# Altium project BB-18 Control Board.PrjPcb (part 2 of 2)

## Sheet Power Supplies.SchDoc
size A; SheetNumber: 3; SheetTotal: 5
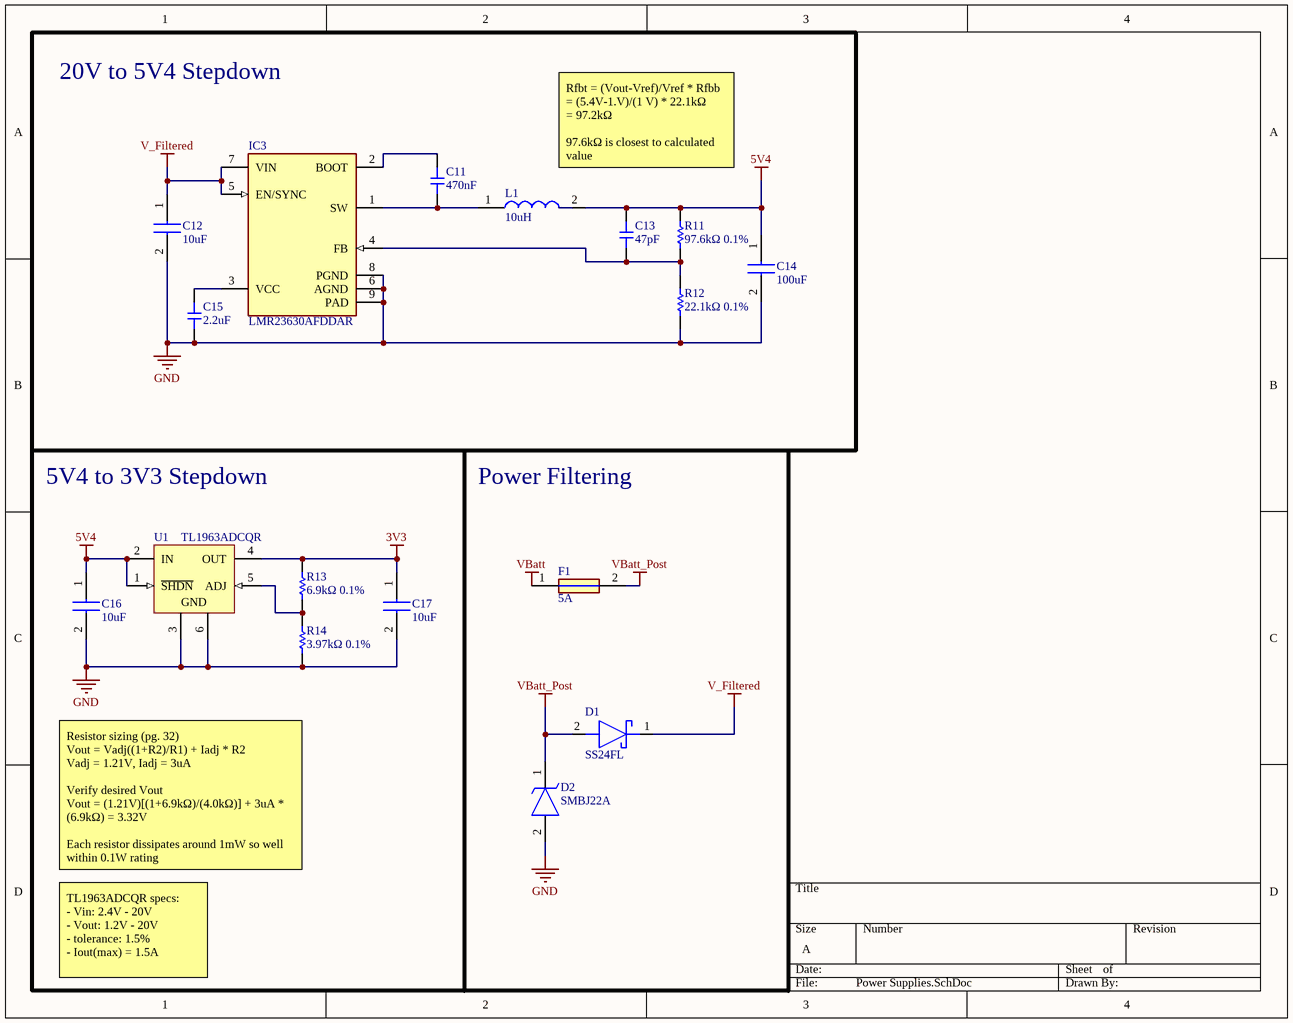
[diagram p4: Power Supplies.SchDoc]

### Parts
C11  Capacitance: 470nF  [CAP-0603]  (hidden comment: CL10B474KA8NNNC)
C12  10uF  [CAPC3225X270N]
C13  Capacitance: 47pF  [CAP-0603]  (hidden comment: CL10C470JB8NNNC)
C14  100uF  [CAPC3225X279N]
C15  Capacitance: 2.2uF  [CAP-0603]  (hidden comment: CL10A225KO8NNNC)
C16  10uF  [CAPC1608X90N]
C17  10uF  [CAPC1608X90N]
D1  SS24FL  [SODFL3617X108N]
D2  SMBJ22A  [SMBJ12A]
F1  5A  [FUSC1608X95N]
IC3  LMR23630AFDDAR  [SOIC127P600X170-9N]
L1  10uH  [SRP6540]
R11  97.6kΩ 0.1%  [RESC1608X55N]
R12  22.1kΩ 0.1%  [RESC1608X55N]
R13  6.9kΩ 0.1%  [RESC1608X55N]
R14  3.97kΩ 0.1%  [RESC1608X55N]
U1  TL1963ADCQR  [DCQ0006A_M]

### Nets
3V3: C17.1 R13.2 U1.4(OUT)
5V4: C13.2 C14.1 C16.1 L1.2 R11.2 U1.1(~{SHDN}) U1.2(IN)
GND: C12.2 C14.2 C15.1 C16.2 C17.2 D2.2(A) IC3.6(AGND) IC3.8(PGND) IC3.9(PAD) R12.1 R14.1 U1.3(GND) U1.6(GND)
V_Filtered: C12.1 D1.1(K) IC3.5(EN/SYNC) IC3.7(VIN)
Vbatt: F1.1
VBatt_Post: D1.2(A) D2.1(K) F1.2
NetC11_1: C11.1 IC3.1(SW) L1.1
NetC11_2: C11.2 IC3.2(BOOT)
NetC13_1: C13.1 IC3.4(FB) R11.1 R12.2
NetC15_2: C15.2 IC3.3(VCC)
NetR13_1: R13.1 R14.2 U1.5(ADJ)

### Notes on the sheet
- 20V to 5V4 Stepdown
- Rfbt = (Vout-Vref)/Vref * Rfbb
  = (5.4V-1.V)/(1 V) * 22.1kΩ
  = 97.2kΩ
  97.6kΩ is closest to calculated value
- 5V4 to 3V3 Stepdown
- Power Filtering
- Resistor sizing (pg. 32)
  Vout = Vadj((1+R2)/R1) + Iadj * R2
  Vadj = 1.21V, Iadj = 3uA
  Verify desired Vout
  Vout = (1.21V)[(1+6.9kΩ)/(4.0kΩ)] + 3uA * (6.9kΩ) = 3.32V
  Each resistor dissipates around 1mW so well within 0.1W rating
- TL1963ADCQR specs:
  - Vin: 2.4V - 20V
  - Vout: 1.2V - 20V
  - tolerance: 1.5%
  - Iout(max) = 1.5A

### Library data of the parts
C11 = CL10B474KA8NNNC: Capacitor, Ceramic (MLCC), 470nF, ±10%, 25V, X7R, ±10%, SMD 0603; Manufacturer: Samsung Electro-Mechanics; Temperature Rating: -55°C ~ 125°C; Capacitance @ 1V DC Bias: 478.182nF; Capacitance @ 1.2V DC Bias: 478.296nF; Capacitance @ 1.35V DC Bias: 478.281nF; Capacitance @ 1.5V DC Bias: 478.153nF; Capacitance @ 1.8V DC Bias: 477.489nF; Capacitance @ 2.5V DC Bias: 472.414nF; Capacitance @ 3.3V DC Bias: 462.957nF; Capacitance @ 3.7V DC Bias: 457.410nF; Capacitance @ 4.2V DC Bias: 450.090nF; Capacitance @ 5V DC Bias: 437.532nF; Capacitance @ 9V DC Bias: 369.261nF; Capacitance @ 12V DC Bias: 317.341nF; Capacitance @ 15V DC Bias: 268.462nF; Capacitance @ 24V DC Bias: 160.798nF; Impedance (0V Bias) @ 100Hz: 3.92E+03Ω; Impedance (0V Bias) @ 500Hz: 796Ω; Impedance (0V Bias) @ 1kHz: 401Ω; Impedance (0V Bias) @ 5kHz: 81.2Ω; Impedance (0V Bias) @ 10kHz: 40.9Ω; Impedance (0V Bias) @ 50kHz: 8.29Ω; Impedance (0V Bias) @ 100kHz: 4.17Ω; Impedance (0V Bias) @ 500kHz: 0.844Ω; Impedance (0V Bias) @ 1MHz: 0.422Ω; Impedance (0V Bias) @ 5MHz: 0.0719Ω; Impedance (0V Bias) @ 10MHz: 0.0175Ω; Impedance (0V Bias) @ 50MHz: 0.0949Ω; Impedance (0V Bias) @ 100MHz: 0.17Ω; Impedance (0V Bias) @ 500MHz: 0.717Ω; Impedance (0V Bias) @ 1GHz: 1.36Ω; Impedance (0V Bias) @ 2GHz: 3.45Ω; Impedance (0V Bias) @ 5GHz: 7.51Ω; Impedance (25V Bias) @ 100Hz: 1.18E+04Ω; Impedance (25V Bias) @ 500Hz: 2.38E+03Ω; Impedance (25V Bias) @ 1kHz: 1.2E+03Ω; Impedance (25V Bias) @ 5kHz: 242Ω; Impedance (25V Bias) @ 10kHz: 121Ω; Impedance (25V Bias) @ 50kHz: 24.5Ω; Impedance (25V Bias) @ 100kHz: 12.3Ω; Impedance (25V Bias) @ 500kHz: 2.47Ω; Impedance (25V Bias) @ 1MHz: 1.22Ω; Impedance (25V Bias) @ 5MHz: 0.256Ω; Impedance (25V Bias) @ 10MHz: 0.109Ω; Impedance (25V Bias) @ 50MHz: 0.11Ω; Impedance (25V Bias) @ 100MHz: 0.171Ω; Impedance (25V Bias) @ 500MHz: 0.718Ω; Impedance (25V Bias) @ 2GHz: 3.41Ω; Impedance (25V Bias) @ 5GHz: 7.6Ω; Package Size: 0603; JLCPCB Basic Part: Yes; JLCPCB Part Number: C1623; Supplier 1: LCSC; Category: Capacitors - MLCC; Supplier Part Number 1: C1623; Manufacturer Part Number: CL10B474KA8NNNC; Tolerance: ±10%; Voltage Rating: 25V; Temperature Coefficient: X7R; RoHS: Yes; ComponentLink1Description: Datasheet; ComponentLink1URL: https://wmsc.lcsc.com/wmsc/upload/file/pdf/v2/lcsc/2304140030_Samsung-Electro-Mechanics-CL10B474KA8NNNC_C1623.pdf; ComponentLink2Description: JLCPCB Part URL; ComponentLink2URL: https://jlcpcb.com/partdetail/C1623; ComponentLink3Description: LCSC Part URL; ComponentLink3URL: https://lcsc.com/product-detail/Multilayer-Ceramic-Capacitors-MLCC---SMD-SMT_Samsung-Electro-Mechanics-Samsung-Electro-Mechanics-CL10B474KA8NNNC_C1623.html; ComponentLink4Description: Samsung Component Library; ComponentLink4URL: https://weblib.samsungsem.com/mlcc/mlcc-ec.do?partNumber=CL10B474KA8NNN; Impedance (25V Bias) @ 1GHz: 1.36Ω
C12 = CL32B106KBJNNNE: CAP CER 10UF 50V X7R 1210; Manufacturer_Name: SAMSUNG; Datasheet Link: https://datasheet.datasheetarchive.com/originals/distributors/Datasheets-DGA10/2406903.pdf; Height: 2.7mm; Manufacturer_Part_Number: CL32B106KBJNNNE; Mouser Part Number: 187-CL32B106KBJNNNE; Mouser Price/Stock: https://www.mouser.co.uk/ProductDetail/Samsung-Electro-Mechanics/CL32B106KBJNNNE?qs=349EhDEZ59rXK%2FOM74I5cg%3D%3D; Arrow Part Number: CL32B106KBJNNNE; Arrow Price/Stock: https://www.arrow.com/en/products/cl32b106kbjnnne/samsung-electro-mechanics.html?utm_currency=USD&region=nac
C13 = CL10C470JB8NNNC: Capacitor, Ceramic (MLCC), 47pF, ±5%, 50V, C0G, ±5%, SMD 0603; Manufacturer: Samsung Electro-Mechanics; Temperature Rating: -55°C ~ 125°C; Impedance (0V Bias) @ 100MHz: 33.5Ω; Impedance (0V Bias) @ 500MHz: 4.98Ω; Impedance (0V Bias) @ 1GHz: 0.296Ω; Impedance (0V Bias) @ 2GHz: 7.28Ω; Impedance (0V Bias) @ 5GHz: 16.2Ω; Package Size: 0603; JLCPCB Basic Part: Yes; JLCPCB Part Number: C1671; Supplier 1: LCSC; Category: Capacitors - MLCC; Supplier Part Number 1: C1671; Manufacturer Part Number: CL10C470JB8NNNC; Tolerance: ±5%; Voltage Rating: 50V; Temperature Coefficient: C0G; RoHS: Yes; ComponentLink1Description: Datasheet; ComponentLink1URL: https://wmsc.lcsc.com/wmsc/upload/file/pdf/v2/lcsc/2304140030_Samsung-Electro-Mechanics-CL10C470JB8NNNC_C1671.pdf; ComponentLink2Description: JLCPCB Part URL; ComponentLink2URL: https://jlcpcb.com/partdetail/C1671; ComponentLink3Description: LCSC Part URL; ComponentLink3URL: https://lcsc.com/product-detail/Multilayer-Ceramic-Capacitors-MLCC---SMD-SMT_Samsung-Electro-Mechanics-Samsung-Electro-Mechanics-CL10C470JB8NNNC_C1671.html; ComponentLink4Description: Samsung Component Library; ComponentLink4URL: https://weblib.samsungsem.com/mlcc/mlcc-ec.do?partNumber=CL10C470JB8NNN
C14 = 1210YD107MAT2A: CAP CER 100UF 16V X5R 1210; Manufacturer_Name: Kyocera AVX; Datasheet Link: https://datasheet.datasheetarchive.com/originals/distributors/DKDS40/DSANUWW008853.pdf; Height: 2.79mm; Manufacturer_Part_Number: 1210YD107MAT2A; Mouser Part Number: 581-1210YD107MAT2A; Mouser Price/Stock: https://www.mouser.co.uk/ProductDetail/KYOCERA-AVX/1210YD107MAT2A?qs=dTuOkNN7mNJArH0RUYK6ig%3D%3D; Arrow Part Number: 1210YD107MAT2A; Arrow Price/Stock: https://www.arrow.com/en/products/1210yd107mat2a/avx.html?utm_currency=USD&region=asia
C15 = CL10A225KO8NNNC: Capacitor, Ceramic (MLCC), 2.2uF, ±10%, 16V, X5R, ±10%, SMD 0603; Manufacturer: Samsung Electro-Mechanics; Temperature Rating: -55°C ~ 85°C; Capacitance @ 1V DC Bias: 2.290uF; Capacitance @ 1.2V DC Bias: 2.232uF; Capacitance @ 1.35V DC Bias: 2.184uF; Capacitance @ 1.5V DC Bias: 2.135uF; Capacitance @ 1.8V DC Bias: 2.033uF; Capacitance @ 2.5V DC Bias: 1.780uF; Capacitance @ 3.3V DC Bias: 1.490uF; Capacitance @ 3.7V DC Bias: 1.365uF; Capacitance @ 4.2V DC Bias: 1.230uF; Capacitance @ 5V DC Bias: 1.046uF; Capacitance @ 9V DC Bias: 0.530uF; Capacitance @ 12V DC Bias: 0.397uF; Capacitance @ 15V DC Bias: 0.295uF; Impedance (0V Bias) @ 100Hz: 748Ω; Impedance (0V Bias) @ 500Hz: 156Ω; Impedance (0V Bias) @ 1kHz: 79.1Ω; Impedance (0V Bias) @ 5kHz: 16.4Ω; Impedance (0V Bias) @ 10kHz: 8.3Ω; Impedance (0V Bias) @ 50kHz: 1.7Ω; Impedance (0V Bias) @ 100kHz: 0.86Ω; Impedance (0V Bias) @ 500kHz: 0.176Ω; Impedance (0V Bias) @ 1MHz: 0.0866Ω; Impedance (0V Bias) @ 5MHz: 0.00777Ω; Impedance (0V Bias) @ 10MHz: 0.0257Ω; Impedance (0V Bias) @ 50MHz: 0.0946Ω; Impedance (0V Bias) @ 100MHz: 0.166Ω; Impedance (0V Bias) @ 500MHz: 0.651Ω; Impedance (0V Bias) @ 1GHz: 1.17Ω; Impedance (0V Bias) @ 2GHz: 2.75Ω; Impedance (0V Bias) @ 5GHz: 5.64Ω; Impedance (16V Bias) @ 100Hz: 5.28E+03Ω; Impedance (16V Bias) @ 500Hz: 1.07E+03Ω; Impedance (16V Bias) @ 1kHz: 539Ω; Impedance (16V Bias) @ 5kHz: 109Ω; Impedance (16V Bias) @ 10kHz: 54.9Ω; Impedance (16V Bias) @ 50kHz: 11.1Ω; Impedance (16V Bias) @ 100kHz: 5.57Ω; Impedance (16V Bias) @ 500kHz: 1.12Ω; Impedance (16V Bias) @ 1MHz: 0.552Ω; Impedance (16V Bias) @ 5MHz: 0.113Ω; Impedance (16V Bias) @ 10MHz: 0.036Ω; Impedance (16V Bias) @ 50MHz: 0.0879Ω; Impedance (16V Bias) @ 100MHz: 0.169Ω; Impedance (16V Bias) @ 500MHz: 0.683Ω; Impedance (16V Bias) @ 1GHz: 1.23Ω; Impedance (16V Bias) @ 2GHz: 2.87Ω; Impedance (16V Bias) @ 5GHz: 5.6Ω; Package Size: 0603; JLCPCB Basic Part: Yes; JLCPCB Part Number: C23630; Supplier 1: LCSC; Category: Capacitors - MLCC; Supplier Part Number 1: C23630; Manufacturer Part Number: CL10A225KO8NNNC; Tolerance: ±10%; Voltage Rating: 16V; Temperature Coefficient: X5R; RoHS: Yes; ComponentLink1Description: Datasheet; ComponentLink1URL: https://wmsc.lcsc.com/wmsc/upload/file/pdf/v2/lcsc/2304140030_Samsung-Electro-Mechanics-CL10A225KO8NNNC_C23630.pdf; ComponentLink2Description: JLCPCB Part URL; ComponentLink2URL: https://jlcpcb.com/partdetail/C23630; ComponentLink3Description: LCSC Part URL; ComponentLink3URL: https://lcsc.com/product-detail/Multilayer-Ceramic-Capacitors-MLCC---SMD-SMT_Samsung-Electro-Mechanics-Samsung-Electro-Mechanics-CL10A225KO8NNNC_C23630.html; ComponentLink4Description: Samsung Component Library; ComponentLink4URL: https://weblib.samsungsem.com/mlcc/mlcc-ec.do?partNumber=CL10A225KO8NNN
C16 C17 = CC0603MRX5R8BB106: Manufacturer_Name: Yageo Group; Datasheet Link: https://datasheet.lcsc.com/lcsc/2006091816_YAGEO-CC0603MRX5R8BB106_C596327.pdf; Height: 0.9mm; Manufacturer_Part_Number: CC0603MRX5R8BB106; Mouser Part Number: 603-CC0603MRX58BB106; Mouser Price/Stock: https://www.mouser.co.uk/ProductDetail/YAGEO/CC0603MRX5R8BB106?qs=tS%2FAHvPQ%2F55gSn%252B6nl2qbw%3D%3D; Arrow Part Number: CC0603MRX5R8BB106; Arrow Price/Stock: https://www.arrow.com/en/products/cc0603mrx5r8bb106/yageo?utm_currency=USD&region=nac
D1 = SS24FL: Schottky Diode; Manufacturer_Name: onsemi; Datasheet Link: https://www.onsemi.com/pub/Collateral/SS26FL-D.PDF; Height: 1.08mm; Manufacturer_Part_Number: SS24FL; Mouser Part Number: 512-SS24FL; Mouser Price/Stock: https://www.mouser.co.uk/ProductDetail/onsemi-Fairchild/SS24FL?qs=tqW9UTzndZyvT5hdH%252BfSxg%3D%3D; Arrow Part Number: SS24FL; Arrow Price/Stock: https://www.arrow.com/en/products/ss24fl/on-semiconductor.html?utm_currency=USD&region=asia
D2 = SMBJ22A: Manufacturer_Name: STMicroelectronics; Datasheet Link: https://www.st.com/resource/en/datasheet/smbj12a.pdf; Height: 2.45mm; Manufacturer_Part_Number: SMBJ22A
F1 = SF-0603SA500M-2: Manufacturer_Name: Bourns; Datasheet Link: https://www.bourns.com/docs/product-datasheets/sf-0603sa-m.pdf?sfvrsn=b5654bf6_12; Height: 0.95mm; Manufacturer_Part_Number: SF-0603SA500M-2; Mouser Part Number: 652-SF-0603SA500M-2; Mouser Price/Stock: https://www.mouser.co.uk/ProductDetail/Bourns/SF-0603SA500M-2?qs=ljCeji4nMDkxudEe5K857A%3D%3D; Arrow Part Number: SF-0603SA500M-2; Arrow Price/Stock: https://www.arrow.com/en/products/sf-0603sa500m-2/bourns?region=nac
IC3 = LMR23630AFDDAR: buck converter, 3A 4V~36V input to 1V~28V output; Manufacturer_Name: Texas Instruments; Datasheet Link: http://www.ti.com/lit/ds/symlink/lmr23630.pdf; Height: 1.7mm; Manufacturer_Part_Number: LMR23630AFDDAR; Mouser Part Number: 595-LMR23630AFDDAR; Mouser Price/Stock: https://www.mouser.co.uk/ProductDetail/Texas-Instruments/LMR23630AFDDAR?qs=8%2FmU9qzJpL918w7tcTwARg%3D%3D; Arrow Part Number: LMR23630AFDDAR; Arrow Price/Stock: https://www.arrow.com/en/products/lmr23630afddar/texas-instruments?utm_currency=USD&region=europe
L1 = SRP6540-100M: Inductor; Manufacturer_Name: Bourns; Datasheet Link: https://www.bourns.com/docs/Product-Datasheets/SRP6540.pdf; Manufacturer_Part_Number: SRP6540-100M; Mouser Part Number: 652-SRP6540-100M; Mouser Price/Stock: https://www.mouser.co.uk/ProductDetail/Bourns/SRP6540-100M?qs=Zq5ylnUbLm4Q0Lm%2FnNPHig%3D%3D; Arrow Part Number: SRP6540-100M; Arrow Price/Stock: https://www.arrow.com/en/products/srp6540-100m/bourns?region=nac; Value: 10uH
R11 = RT0603BRD0797K6L: RES SMD 97.6KOHM 0.1% 1/10W 0603
R12 = ERA-3VEB2212V: RES 22.1K OHM 0.1% 1/8W 0603
R13 = RT0603BRD076K9L: RES SMD 6.9K OHM 0.1% 1/10W 0603; ComponentLink1Description: New link; ComponentLink1URL: https://yageogroup.com/content/datasheet/asset/file/PYU-RT_1-TO-0-01_ROHS_L
R14 = RT0603BRD073K97L: RES SMD 3.97KOHM 0.1% 1/10W 0603; ComponentLink1Description: New link; ComponentLink1URL: https://yageogroup.com/content/datasheet/asset/file/PYU-RT_1-TO-0-01_ROHS_L
U1 = CMP-0395-00366-2: Single Output Fast Transient Response LDO, 1.5 A, Adjustable 1.21 to 20 V Output, 2.1 to 20 V Input, 6-pin SOT-223 (DCQ), -40 to 125 degC, Green (RoHS & no Sb/Br); Manufacturer: Texas Instruments; Iout(Max)(A): 1.5; Vout Adj(Min)(V): 1.21; Vin(Min)(V): 2.1; SubFamily: Single Channel LDO; Vout Adj(Max)(V): 20; Vdo(Typ)(mV): 340; Iq(Typ)(mA): 1; PackageVersion: 4202109/D; ComponentLink3URL: http://www.ti.com/litv/pdf/mpds098c; ComponentLink2Description: Datasheet; PartNumber: TL1963ADCQR; Eco-Plan: Green (RoHS & no Sb/Br); Mounting Technology: Surface Mount; PackageReference: DCQ0006A; DatasheetVersion: SLVS719F; ComponentLink1URL: http://www.ti.com/; ComponentLink3Description: Package Specification; ComponentLink2URL: http://www.ti.com/general/docs/lit/getliterature.tsp?genericPartNumber=TL1963A&fileType=pdf; Vin(Max)(V): 20; ComponentLink1Description: Manufacturer URL; PackageDescription: 6-Pin Plastic Small Outline, Body 3.5 x 6.5 mm, Pitch 1.27 mm

## Nets that join several sheets
3V3: MCU (15 pins), Interface (R1.2 TP1.1), Motor Driver (8 pins), Power Supplies (C17.1 R13.2 U1.4)
5V4: Interface (D3.2 R9.2 TP2.1), Power Supplies (7 pins)
GND: MCU (29 pins), Interface (15 pins), Motor Driver (46 pins), Power Supplies (13 pins)
Vbatt: Interface (J1.2), Power Supplies (F1.1)
VBatt_Post: Motor Driver (21 pins), Power Supplies (D1.2 D2.1 F1.2)
CS: MCU (IC1.32), Interface (J6.12)
Data_Ready: MCU (IC1.33), Interface (J6.13)
DIAG1: MCU (IC1.4), Motor Driver (IC4.11)
DIAG2: MCU (IC1.5), Motor Driver (IC5.11)
DIAG3: MCU (IC1.6), Motor Driver (IC6.11)
DIR1: Interface (J7.12), Motor Driver (IC4.19)
DIR2: Interface (J7.14), Motor Driver (IC5.19)
DIR3: Interface (J7.17), Motor Driver (IC6.19)
ENN: MCU (IC1.34 R5.2), Motor Driver (IC4.2 IC5.2 IC6.2)
OA1_1: Interface (J3.4), Motor Driver (IC4.24)
OA1_2: Interface (J4.4), Motor Driver (IC5.24)
OA1_3: Interface (J5.4), Motor Driver (IC6.24)
OA2_1: Interface (J3.3), Motor Driver (IC4.21)
OA2_2: Interface (J4.3), Motor Driver (IC5.21)
OA2_3: Interface (J5.3), Motor Driver (IC6.21)
OB1_1: Interface (J3.2), Motor Driver (IC4.26)
OB1_2: Interface (J4.2), Motor Driver (IC5.26)
OB1_3: Interface (J5.2), Motor Driver (IC6.26)
OB2_1: Interface (J3.1), Motor Driver (IC4.1)
OB2_2: Interface (J4.1), Motor Driver (IC5.1)
OB2_3: Interface (J5.1), Motor Driver (IC6.1)
PICO: MCU (IC1.30), Interface (J6.10)
POCI: MCU (IC1.31), Interface (J6.11)
SCK: MCU (IC1.29), Interface (J6.9)
STEP1: Interface (J7.11), Motor Driver (IC4.16)
STEP2: Interface (J7.13), Motor Driver (IC5.16)
STEP3: Interface (J7.15), Motor Driver (IC6.16)
UART: MCU (IC1.11 R4.1), Motor Driver (IC4.14 IC5.14 IC6.14)
USB_D+: MCU (C6.2 R7.1), Interface (J2.A6 J2.B6)
USB_D-: MCU (C5.2 R6.1), Interface (J2.A7 J2.B7)